# Altium schematic sheet Sensor_LIS2MDL.SchDoc: Sensors - Magnetometer LIS2MDL (I2C4)
size A3; ApprovedBy: Weymen Koo; CheckedBy: -; DrawnBy: Weymen Koo; DocumentNumber: UBCAD-FCSOM-SCH; Revision: A; SheetNumber: 9; SheetTotal: 18; ProjectTitle: Flight Controller SoM; Status: PRELIMINARY; ReleaseDate: 2026-11-14
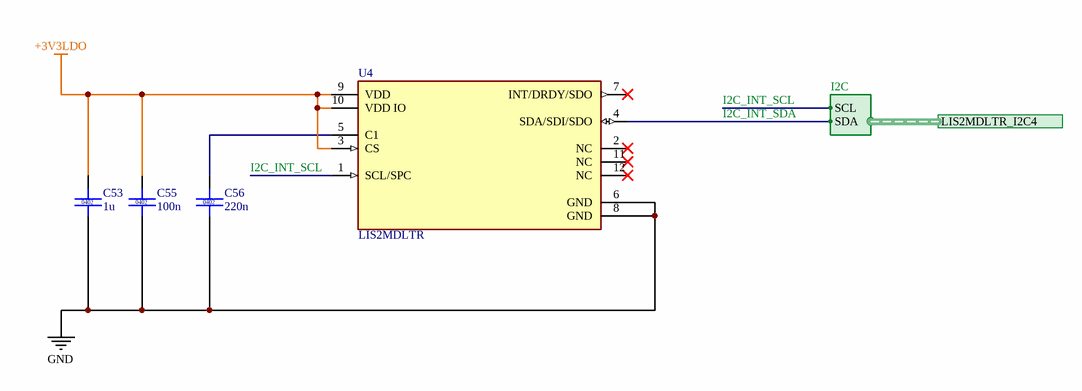
[diagram p0: Sensor_LIS2MDL.SchDoc]

## Parts
C53  1u  [CAPC1005X05N]
C55  100n  [CAPC1005X05N]
C56  220n  [CAPC1005X05N]
U4  LIS2MDLTR  [FP-LGA-12-DM00170568-MFG]

## Ports
LIS2MDLTR_I2C4 (harness I2C, see 1[5B], 4[0@])

## Harnesses
I2C: SDA, SCL

## Nets
+3V3LDO: C53.1 C55.1 U4.3(CS) U4.9(VDD) U4.10(VDD_IO)
GND: C53.2 C55.2 C56.2 U4.6(GND) U4.8(GND)
I2C_INT_SCL: U4.1(SCL/SPC) ; port LIS2MDLTR_I2C4.SCL
I2C_INT_SDA: U4.4(SDA/SDI/SDO) ; port LIS2MDLTR_I2C4.SDA
NetC56_1: C56.1 U4.5(C1)

Not connected (* = marked no-connect by the designer): U4 2(NC)* 7(INT/DRDY/SDO)* 11(NC)* 12(NC)*

## Notes on the sheet
- PROJECT
- KEY
- POWER
- 5 V class
- 3.3 V class
- Core / SMPS
- GND
- SHEET TITLE
- SIGNALS
- NOTES
- SPI
- Analog
- Design
- I2C
- PWM/Timer
- Layout
- UART/RC
- GPIO/Ctrl
- Assembly
- CAN
- Unused pin
- Firmware
- USB/SD/Clk
- Critical
- DRAWN
- DOCUMENT NO.
- CHECKED
- REV
- STATUS
- APPROVED
- DATE
- FILE
- SIZE
- A3
- SHEET
- of

## Library data of the parts
C53 = CMP-002-000094-5: CAP 1u 25V X5R 10% 0402; Manufacturer: Samsung; Manufacturer Part Number: CL05A105KA5NQNC; Value: 1u; Tolerance: 10%; Package: 0402; Voltage: 25V; Dielectric: X5R; LCSC Part #: C52923
C55 = CMP-002-000094-5: CAP 100n 16V X7R 10% 0402; Manufacturer: Samsung; Manufacturer Part Number: CL05B104KO5NNNC; Value: 100n; Tolerance: 10%; Package: 0402; Voltage: 16V; Dielectric: X7R; LCSC Part #: C1525
C56 = CMP-002-000094-5: CAP 220n 16V X7R 10% 0402; Manufacturer: Samsung; Manufacturer Part Number: CL05B224KO5NNNC; Value: 220n; Tolerance: 10%; Package: 0402; Voltage: 16V; Dielectric: X7R; LCSC Part #: C16772
U4 = CMP-12173-000002-1: SENSOR MR I2C/SPI 12LGA; Manufacturer: STMicroelectronics; Sensing Method: Magnetic; Min Supply Voltage: 1.71V; Sensor Output: I2C,SPI; Operating Supply Current: 50-200uA; Max Supply Voltage: 3.6V; Octopart: https://octopart.com/lis2mdltr-stmicroelectronics-81117311; RoHS: TRUE; Device Class L3: unset; Device Class L1: Sensors; ComponentLink2URL: https://www.st.com/resource/en/datasheet/lis2mdl.pdf; Automotive: No; Device Class L2: Magnetic Sensors; Lead Free: Yes; Temperature: -40°C to +85°C; Manufacturer Part Number: LIS2MDLTR; Temperature Range High: +85°C; Height: 0.7mm; Digikey Description: SENSOR MR I2C/SPI 12LGA; Category: IC; ComponentLink2Description: Datasheet; Package: LGA-12-DM00170568; Temperature Range Low: -40°C